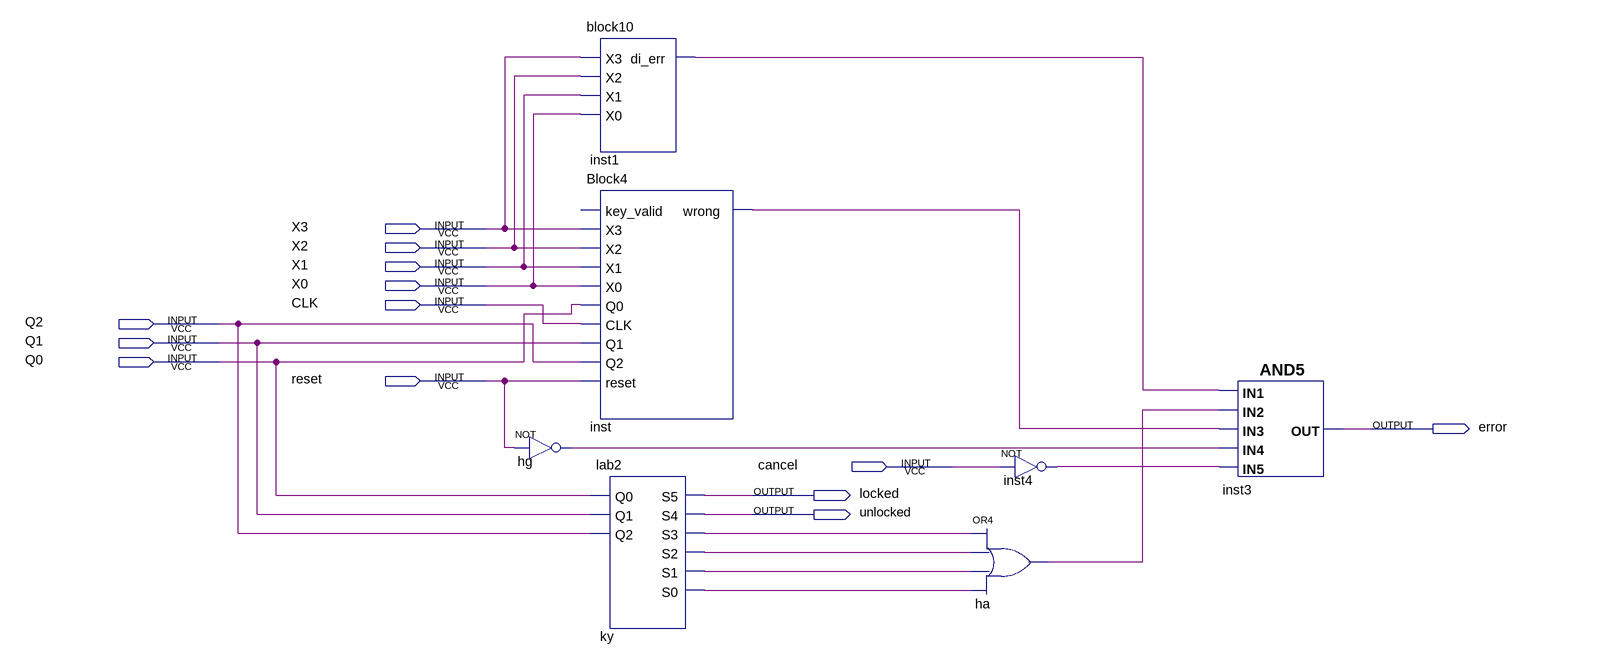
[diagram p0: schematic sheet]
// Quartus schematic block17.bdf as structural Verilog: 7 symbols, 13 pins
module block17 (
  input  X3,
  input  X2,
  input  X1,
  input  X0,
  input  CLK,
  input  Q2,
  input  Q1,
  input  Q0,
  input  reset,
  input  cancel,
  output error,
  output locked,
  output unlocked
);

  wire ha_out, hg_out, inst1_di_err, inst4_out, inst_wrong, ky_s0, ky_s1, ky_s2, ky_s3;

  not hg (hg_out, reset);
  block10 inst1 (.X3(X3), .X2(X2), .X1(X1), .X0(X0), .di_err(inst1_di_err));
  Block4 inst (
    .X3(X3), .X2(X2), .X1(X1), .X0(X0), .Q0(Q0), .CLK(CLK), .Q1(Q1), .Q2(Q2), .reset(reset),
    .wrong(inst_wrong));  // open: key_valid
  lab2 ky (.Q0(Q0), .Q1(Q1), .Q2(Q2), .S5(locked), .S4(unlocked), .S3(ky_s3), .S2(ky_s2), .S1(ky_s1), .S0(ky_s0));
  or ha (ha_out, ky_s3, ky_s2, ky_s1, ky_s0);
  not inst4 (inst4_out, cancel);
  and inst3 (error, inst1_di_err, ha_out, inst_wrong, hg_out, inst4_out);
endmodule
